# Altium schematic sheet Radar_Schematic.SchDoc
size A4; SheetNumber: 1; SheetTotal: 1
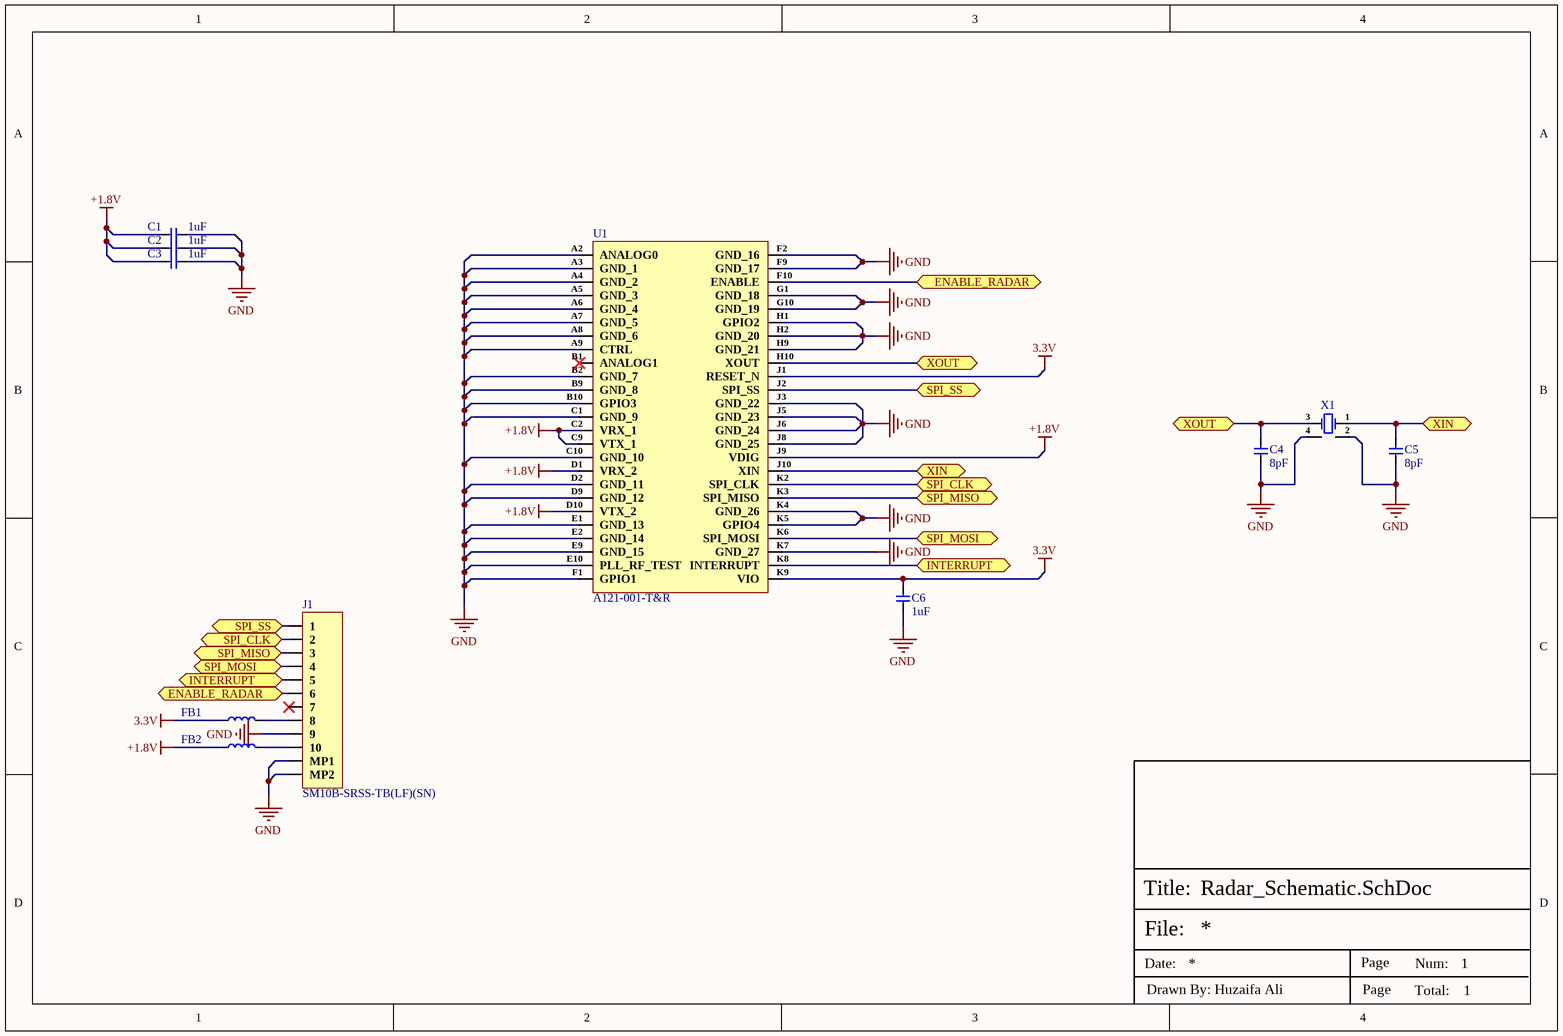
[diagram p0: Radar_Schematic.SchDoc]

## Parts
C1  1uF  [Cap-0402]
C2  1uF  [Cap-0402]
C3  1uF  [Cap-0402]
C4  8pF  [Cap-0402]
C5  8pF  [Cap-0402]
C6  1uF  [Cap-0402]
FB1  BLM15PD121SN1D  [IND-0402]  (value not drawn)
FB2  BLM15PD121SN1D  [IND-0402]  (value not drawn)
J1  SM10B-SRSS-TB(LF)(SN)  [SM10B-SRSS-TB(LF)(SN)]
U1  A121-001-T&R  [50-FCCSP (5.2x5.5)]
X1  ECS-240-8-36-RWN-TR3  [SMD2520-4P]  (value not drawn)

## Ports
ENABLE_RADAR (bidir, see Radar_Schematic[1C]), ENABLE_RADAR (bidir, see Radar_Schematic[3B]), INTERRUPT (bidir, see Radar_Schematic[1C]), INTERRUPT (bidir, see Radar_Schematic[3C]), SPI_CLK (bidir, see Radar_Schematic[1C]), SPI_CLK (bidir, see Radar_Schematic[3B]), SPI_MISO (bidir, see Radar_Schematic[1C]), SPI_MISO (bidir, see Radar_Schematic[3B]), SPI_MOSI (bidir, see Radar_Schematic[1C]), SPI_MOSI (bidir, see Radar_Schematic[3C]), SPI_SS (bidir, see Radar_Schematic[1C]), SPI_SS (bidir, see Radar_Schematic[3B]), XIN (bidir, see Radar_Schematic[3B]), XIN (bidir, see Radar_Schematic[4B]), XOUT (bidir, see Radar_Schematic[3B]), XOUT (bidir, see Radar_Schematic[4B])

## Nets
3.3V: C6.1 FB1.1 U1.J1(RESET_N) U1.K9(VIO)
+1.8V: C1.1 C2.1 C3.1 FB2.1 U1.C2(VRX_1) U1.C9(VTX_1) U1.D1(VRX_2) U1.D10(VTX_2) U1.J9(VDIG)
GND: C1.2 C2.2 C3.2 C4.1 C5.1 C6.2 J1.9 J1.MP1 J1.MP2 U1.A2(ANALOG0) U1.A3(GND_1) U1.A4(GND_2) U1.A5(GND_3) U1.A6(GND_4) U1.A7(GND_5) U1.A8(GND_6) U1.A9(CTRL) U1.B2(GND_7) U1.B9(GND_8) U1.B10(GPIO3) U1.C1(GND_9) U1.C10(GND_10) U1.D2(GND_11) U1.D9(GND_12) U1.E1(GND_13) U1.E2(GND_14) U1.E9(GND_15) U1.E10(PLL_RF_TEST) U1.F1(GPIO1) U1.F2(GND_16) U1.F9(GND_17) U1.G1(GND_18) U1.G10(GND_19) U1.H1(GPIO2) U1.H2(GND_20) U1.H9(GND_21) U1.J3(GND_22) U1.J5(GND_23) U1.J6(GND_24) U1.J8(GND_25) U1.K4(GND_26) U1.K5(GPIO4) U1.K7(GND_27) X1.2(GND) X1.4(GND)
ENABLE_RADAR: J1.6 U1.F10(ENABLE) ; port ENABLE_RADAR
INTERRUPT: J1.5 U1.K8(INTERRUPT) ; port INTERRUPT
SPI_CLK: J1.2 U1.K2(SPI_CLK) ; port SPI_CLK
SPI_MISO: J1.3 U1.K3(SPI_MISO) ; port SPI_MISO
SPI_MOSI: J1.4 U1.K6(SPI_MOSI) ; port SPI_MOSI
SPI_SS: J1.1 U1.J2(SPI_SS) ; port SPI_SS
XIN: C5.2 U1.J10(XIN) X1.1(IN/OUT) ; port XIN
XOUT: C4.2 U1.H10(XOUT) X1.3(Out/In) ; port XOUT
NetFB1_2: FB1.2 J1.8
NetFB2_2: FB2.2 J1.10

Not connected (* = marked no-connect by the designer): J1 7*; U1 B1(ANALOG1)*

## Notes on the sheet
- File:
- Title:
- Date:
- Page
- Num:
- Total:
- Drawn By: Huzaifa Ali

## Library data of the parts
C1-C3 C6 = CC0402KRX5R6BB105: CAP CER 1UF 10V X5R 0402; Manufacturer: Yageo; Tolerance: 10%; Dissipation Factor: 15%; Item Type: Capacitor; Supplier 1: Mouser; Manufacturer Part Number: CC0402KRX5R6BB105; RoHS: Yes; Category: Ceramic Capacitors; Stock 1: 6711367; Pricing 1: 1=0.11000, 10=0.05500, 50=0.05500, 100=0.03300, 500=0.02700, 1000=0.02200, 2500=0.02100, 10000=0.01800 (USD); Mount: Surface Mount; Case/Package: 0402; Number of Pins: 2; Case Code (Metric): 1005; Case Code (Imperial): 0402; Min Operating Temperature: -55°C; Max Operating Temperature: 85°C; Capacitance: 1uF; Dielectric: X5R; Package Quantity: 1; Voltage Rating: 10V; Packaging: Tape and Reel; Voltage Rating (DC): 10V; Termination: SMD/SMT; Resistor Type: Ceramic; Series: CC; Construction: Flat; Length: 1mm; Width: 0.02inch; Height: 0.5mm; Thickness: 0.022inch; Depth: 0.5mm; Radiation Hardening: No; REACH SVHC: No SVHC; Lead Free: Lead Free; Halogen Free: Halogen Free; RoHS Compliant: Yes; ComponentLink1URL: https://datasheet.ciiva.com/176/upy-gphc-x5r-4v-to-50v-12-176704.pdf?src-supplier=Digi-Key; ComponentLink1Description: https://datasheet.ciiva.com/176/upy-gphc-x5r-4v-to-50v-12-176704.pdf?src-supplier=Digi-Key; ComponentLink2URL: https://datasheet.ciiva.com/176/mlccorderingcode-176705.pdf?src-supplier=Digi-Key; ComponentLink2Description: https://datasheet.ciiva.com/176/mlccorderingcode-176705.pdf?src-supplier=Digi-Key; ComponentLink3URL: https://datasheet.ciiva.com/176/mlccorderingcode-176706.pdf?src-supplier=Digi-Key; ComponentLink3Description: https://datasheet.ciiva.com/176/mlccorderingcode-176706.pdf?src-supplier=Digi-Key; Supplier Part Number 1: 603-CC402KRX5R6BB105; LCSC Part Number: C106254
C4 C5 = 0402CG8R0C500NT: 50V 8pF C0G 0402 Multilayer Ceramic Capacitors MLCC - SMD/SMT ROHS; Manufacturer: FH (Guangdong Fenghua Advanced Tech); Manufacturer Part Number: 0402CG8R0C500NT; Package: 0402; LCSC Part Number: C1578; Item Type: Capacitor; ComponentLink1Description: LCSC; ComponentLink1URL: https://www.lcsc.com/product-detail/Multilayer-Ceramic-Capacitors-MLCC-SMD-SMT_FH-Guangdong-Fenghua-Advanced-Tech-0402CG8R0C500NT_C1578.html
FB1 FB2 = BLM15PD121SN1D: FERRITE BEAD 120 OHM 0402 1LN; Manufacturer: Murata; Material: Steel,Ferrite; Tolerance: 25%; Impedance: 120R; Current Rating: 1.3A; Number of Lines: 1; DC Resistance (DCR): 90mR; Test Frequency: 100MHz; Supplier 1: Avnet; Manufacturer Part Number: BLM15PD121SN1D; RoHS: Yes; Category: Ferrite Beads and Chips; Stock 1: 300000; Pricing 1: 10000=0.03238, 20000=0.03063, 40000=0.02888, 60000=0.02713, 80000=0.02538, 100000=0.02363, 1000000=0.02188 (USD); Case/Package: 0402; Number of Pins: 2; Core Material: Ferrite; Case Code (Metric): 1005; Case Code (Imperial): 0402; Min Operating Temperature: -55°C; Max Operating Temperature: 125°C; Package Quantity: 1; Packaging: Tape and Reel; Max Current Rating: 1.3A; Termination: SMD/SMT; Max DC Current: 1.3A; DC Current: 1.3A; Number of Circuits: 1; Series: BLM15PD; DC Resistance-Max: 90mR; Length: 1mm; Width: 0.5mm; Height: 0.5mm; Depth: 0.55mm; Radiation Hardening: No; Reach SVHC Compliant: Yes; Military Standard: Not; Lead Free: Lead Free; RoHS Compliant: Yes; ComponentLink1URL: https://datasheet.ciiva.com/11800/0900766b811b5866-11800860.pdf?src-supplier=RSComponents; ComponentLink1Description: https://datasheet.ciiva.com/11800/0900766b811b5866-11800860.pdf?src-supplier=RSComponents; ComponentLink2URL: https://datasheet.ciiva.com/18093/getdatasheetpartid-195858-18093157.pdf?src-supplier=Verical; ComponentLink2Description: https://datasheet.ciiva.com/18093/getdatasheetpartid-195858-18093157.pdf?src-supplier=Verical; ComponentLink3URL: https://datasheet.ciiva.com/41425/001171686-da-01-en-chip-drossel0402-120r-1300ma-1-0x0-5mm-41425776.pdf?src-supplier=Conrad; ComponentLink3Description: https://datasheet.ciiva.com/41425/001171686-da-01-en-chip-drossel0402-120r-1300ma-1-0x0-5mm-41425776.pdf?src-supplier=Conrad; ComponentLink4URL: https://datasheet.ciiva.com/41449/001172205-da-01-en-drossel-0402-120r-11-0x0-5mm-10000st-41449495.pdf?src-supplier=Conrad; ComponentLink4Description: https://datasheet.ciiva.com/41449/001172205-da-01-en-drossel-0402-120r-11-0x0-5mm-10000st-41449495.pdf?src-supplier=Conrad; ComponentLink5URL: https://datasheet.ciiva.com/1012/l0110e-1012435.pdf?src-supplier=Digi-Key; ComponentLink5Description: https://datasheet.ciiva.com/1012/l0110e-1012435.pdf?src-supplier=Digi-Key; ComponentLink6URL: https://datasheet.ciiva.com/1012/l0110e-1012434.pdf?src-supplier=Digi-Key; ComponentLink6Description: https://datasheet.ciiva.com/1012/l0110e-1012434.pdf?src-supplier=Digi-Key; ComponentLink7URL: https://datasheet.ciiva.com/1012/l0110e-1012436.pdf?src-supplier=Digi-Key; ComponentLink7Description: https://datasheet.ciiva.com/1012/l0110e-1012436.pdf?src-supplier=Digi-Key; Supplier Part Number 1: BLM15PD121SN1D; LCSC Part Number: C76891; Item Type: Ferrite Bead
J1 = SM10B-SRSS-TB(LF)(SN): CONN HEADER SMD R/A 10POS 1MM; Manufacturer: JST; Contact Resistance: 40mR; Current Rating: 1A; Voltage Rating (AC): 50V; Gender: Male; Number of Positions: 10; Insulation Resistance: 100MR; Item Type: JST Connector; Supplier 1: Future Electronics; Manufacturer Part Number: SM10B-SRSS-TB(LF)(SN); RoHS: Yes; Category: Connectors; Pricing 1: 3000=0.64500 (USD); Mount: Surface Mount; Contact Plating: Tin,Lead,Copper; Contact Material: Copper Alloy; Color: Natural; Material: Polyamide; Housing Color: Beige; Housing Material: Polyamide; Contact Shape: Square; Contact Finish - Mating: TIN; Insulation Material: Nylon; Insulation Color: Natural; Min Operating Temperature: -25°C; Max Operating Temperature: 85°C; Number of Rows: 1; Packaging: Tape and Reel; Max Current Rating: 1A; Voltage Rating: 50V; Termination: Solder; Max Voltage Rating (AC): 50V; Number of Contacts: 10; Orientation: Right Angle; Connector Type: Header; Series: SR; Contact Type: Male Pin; Fastening Type: Pull; Length: 12mm; Lead Pitch: 1mm; Pitch: 1mm; Depth: 4.95mm; Reach SVHC Compliant: Yes; Lead Free: Lead Free; Flammability Rating: UL94 V-0; ComponentLink1URL: https://datasheet.ciiva.com/26894/getdatasheetpartid-708886-26894682.pdf?src-supplier=Verical; ComponentLink1Description: https://datasheet.ciiva.com/26894/getdatasheetpartid-708886-26894682.pdf?src-supplier=Verical; ComponentLink2URL: https://datasheet.ciiva.com/16221/sm10b-srss-tblfsn-16221242.pdf?src-supplier=Future+Electronics; ComponentLink2Description: https://datasheet.ciiva.com/16221/sm10b-srss-tblfsn-16221242.pdf?src-supplier=Future+Electronics; ComponentLink3URL: https://datasheet.ciiva.com/11752/0900766b8082f550-11752172.pdf?src-supplier=RSComponents; ComponentLink3Description: https://datasheet.ciiva.com/11752/0900766b8082f550-11752172.pdf?src-supplier=RSComponents; ComponentLink4URL: https://datasheet.ciiva.com/712/esr-712644.pdf?src-supplier=Digi-Key; ComponentLink4Description: https://datasheet.ciiva.com/712/esr-712644.pdf?src-supplier=Digi-Key; ComponentLink5URL: https://datasheet.ciiva.com/712/esr-712645.pdf?src-supplier=Digi-Key; ComponentLink5Description: https://datasheet.ciiva.com/712/esr-712645.pdf?src-supplier=Digi-Key; ComponentLink6URL: https://datasheet.ciiva.com/730/esr-730692.pdf?src-supplier=Digi-Key; ComponentLink6Description: https://datasheet.ciiva.com/730/esr-730692.pdf?src-supplier=Digi-Key; Supplier Part Number 1: 1165778; LCSC Part Number: C160409
U1 = A121-001-T&R: RADAR SENSOR SYSTEM-IN-PACKAGE B; Manufacturer: Acconeer; Item Type: IC; Supplier: Mouser; Supplier Part Number: 925-A121-001-T&R; Manufacturer Part Number: A121-001-T&R; RoHS: No; Category: LDO; Stock: 7442; Pricing: 1=13.72, 10=11.57, 50=10.22, 100=8.78, 1000=7.74, 10000=6.41 (USD)
X1 = ECS-240-8-36-RWN-TR3: CRYSTAL 24.0000MHZ 8PF SMD; Manufacturer: ECS Inc.; Package: None; Manufacturer Part Number: ECS-240-8-36-RWN-TR3; Item Type: Crystal